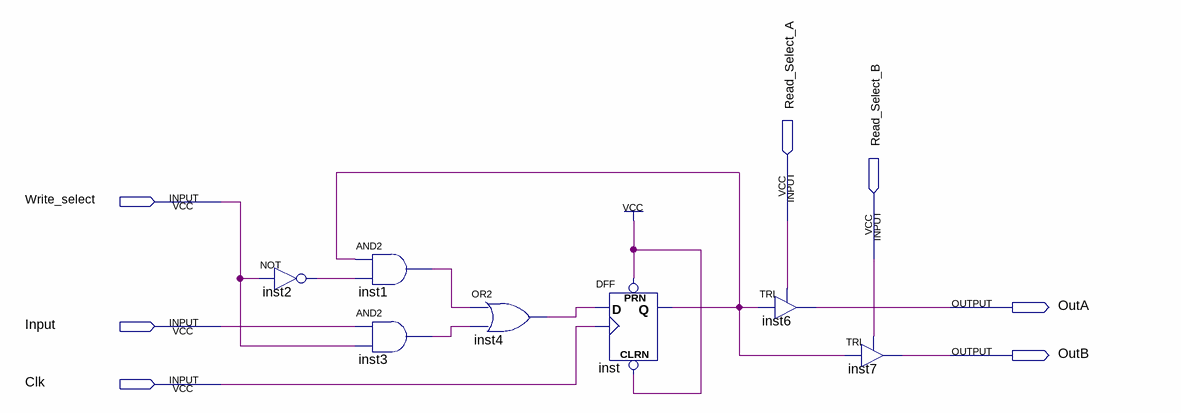
[diagram p0: schematic sheet]
// Quartus schematic register-file-cell.bdf as structural Verilog: 7 symbols, 7 pins
module \register-file-cell  (
  input  Write_select,
  input  Read_Select_A,
  input  Read_Select_B,
  input  Input,
  input  Clk,
  output OutA,
  output OutB
);

  wire inst1_out, inst2_out, inst3_out, inst4_out, inst_q;

  not inst2 (inst2_out, Write_select);
  and inst1 (inst1_out, inst_q, inst2_out);
  and inst3 (inst3_out, Input, Write_select);
  or inst4 (inst4_out, inst1_out, inst3_out);
  DFF inst (.CLRN(1'b1), .CLK(Clk), .D(inst4_out), .PRN(1'b1), .Q(inst_q));
  TRI inst6 (.IN(inst_q), .OE(Read_Select_A), .OUT(OutA));
  TRI inst7 (.IN(inst_q), .OE(Read_Select_B), .OUT(OutB));
endmodule
